# Altium project Gateway_Node.PrjPcb
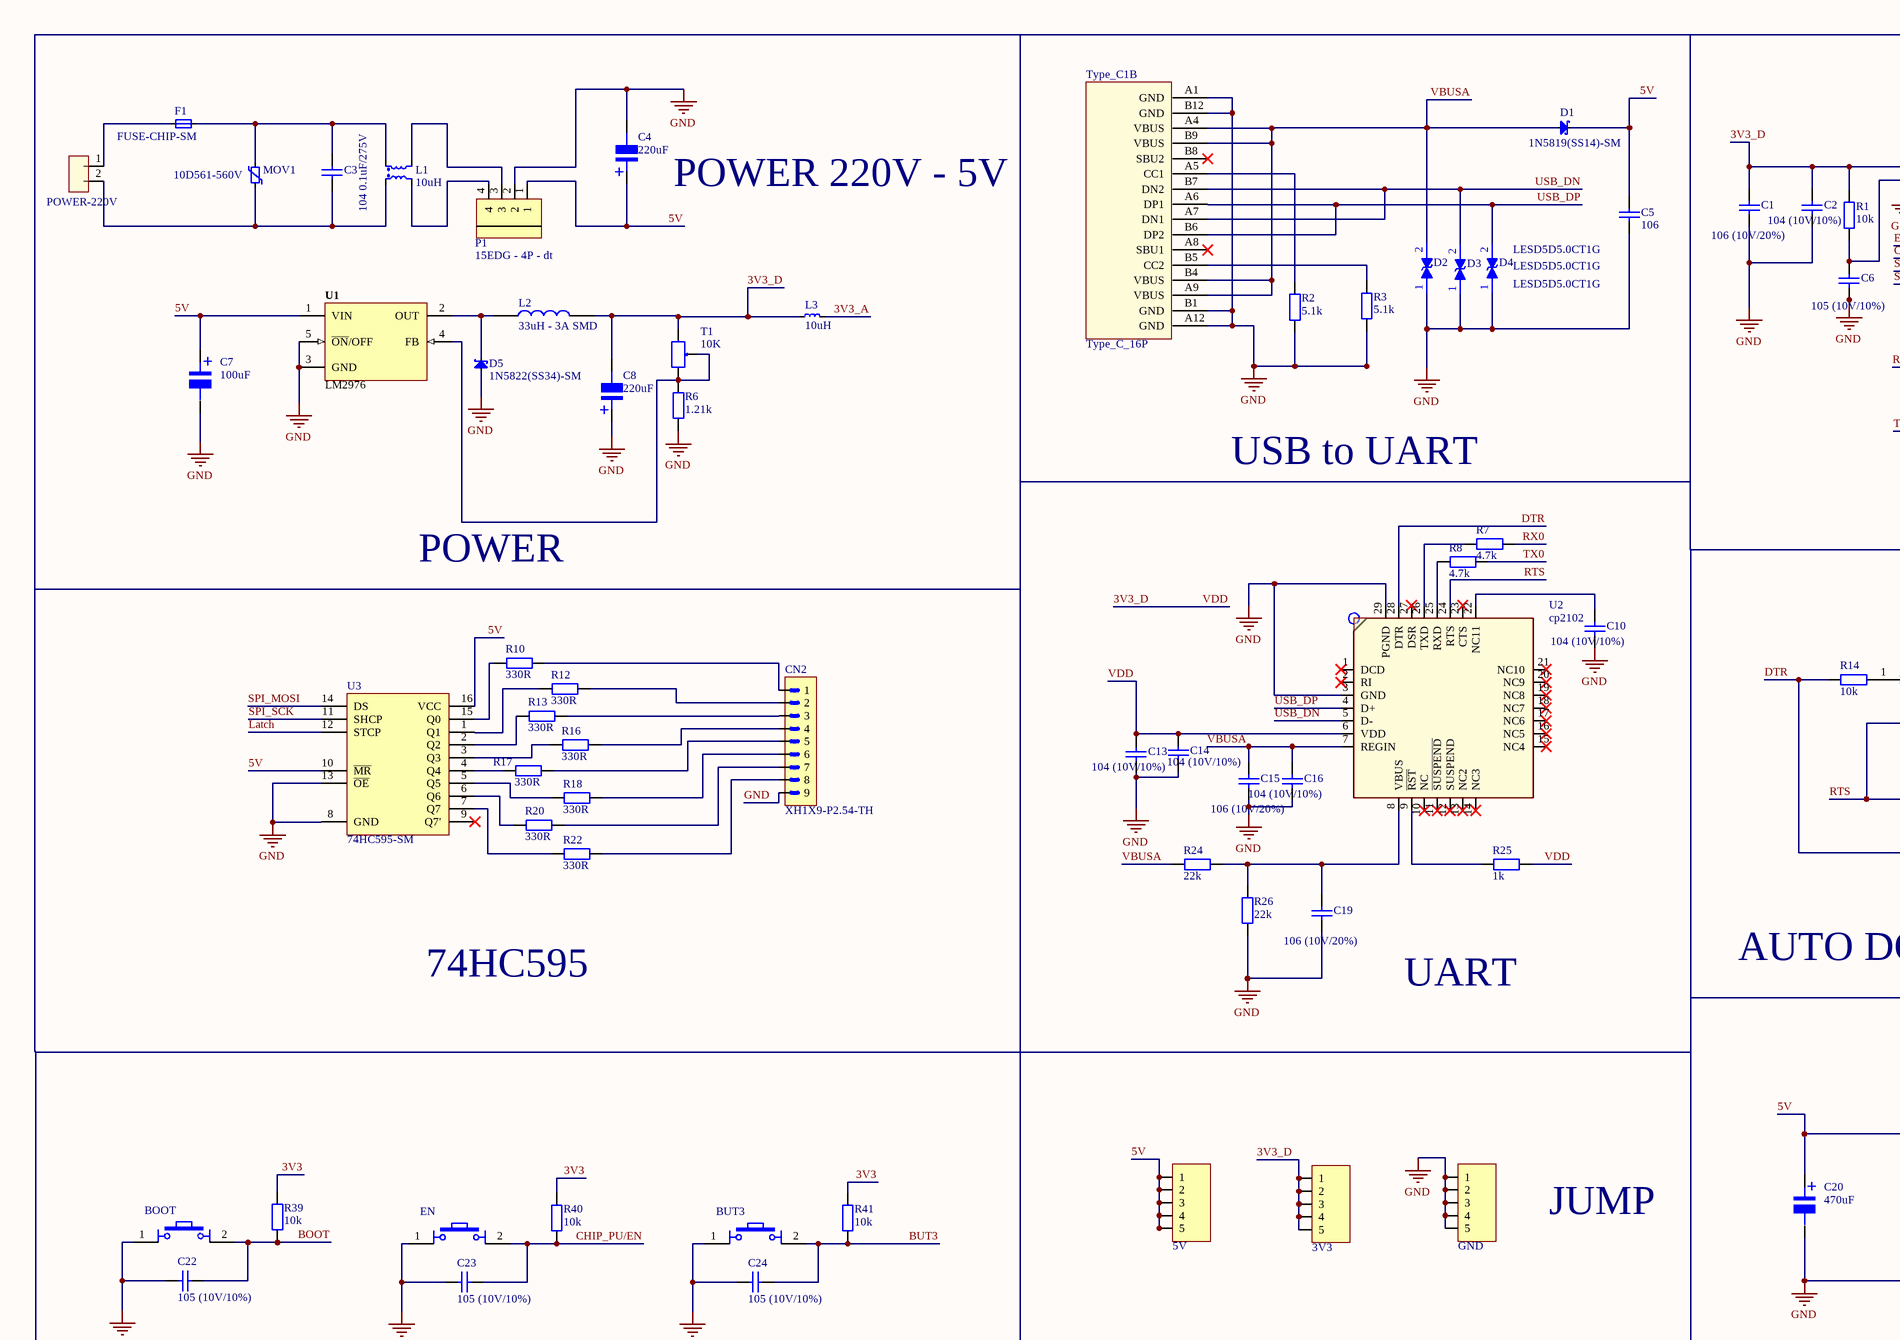
[diagram p0: Sche_gateway.SchDoc, top left]
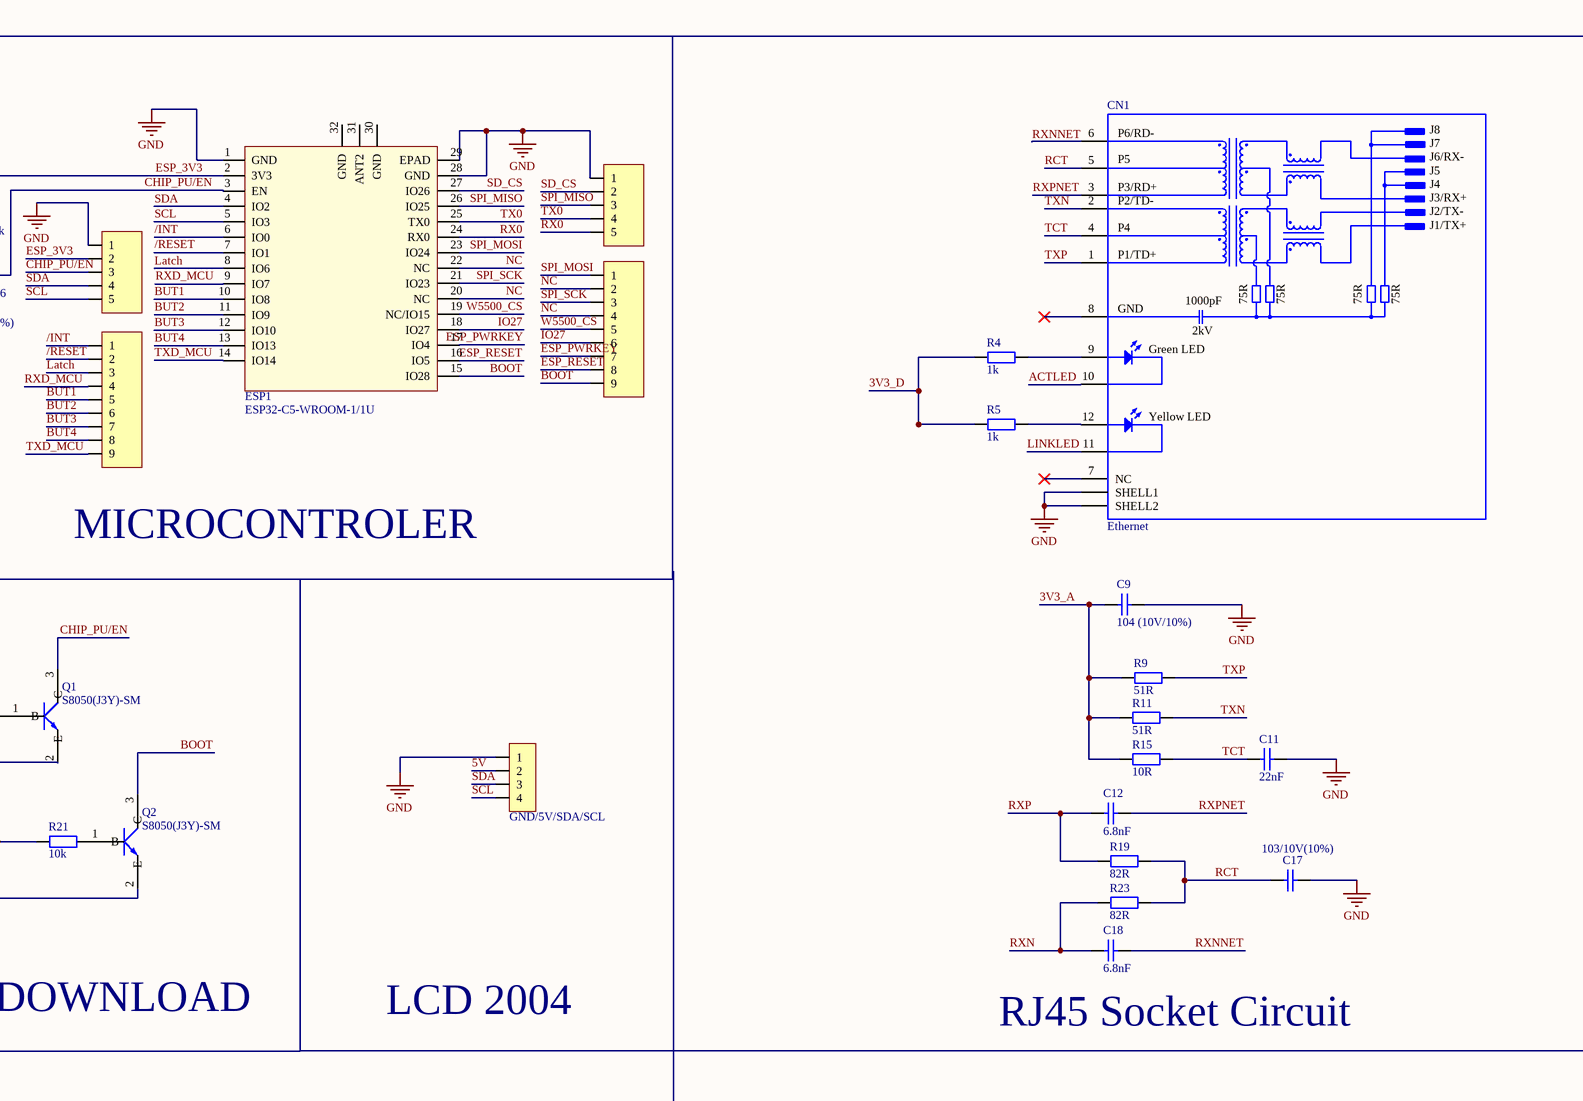
[diagram p1: Sche_gateway.SchDoc, top right]
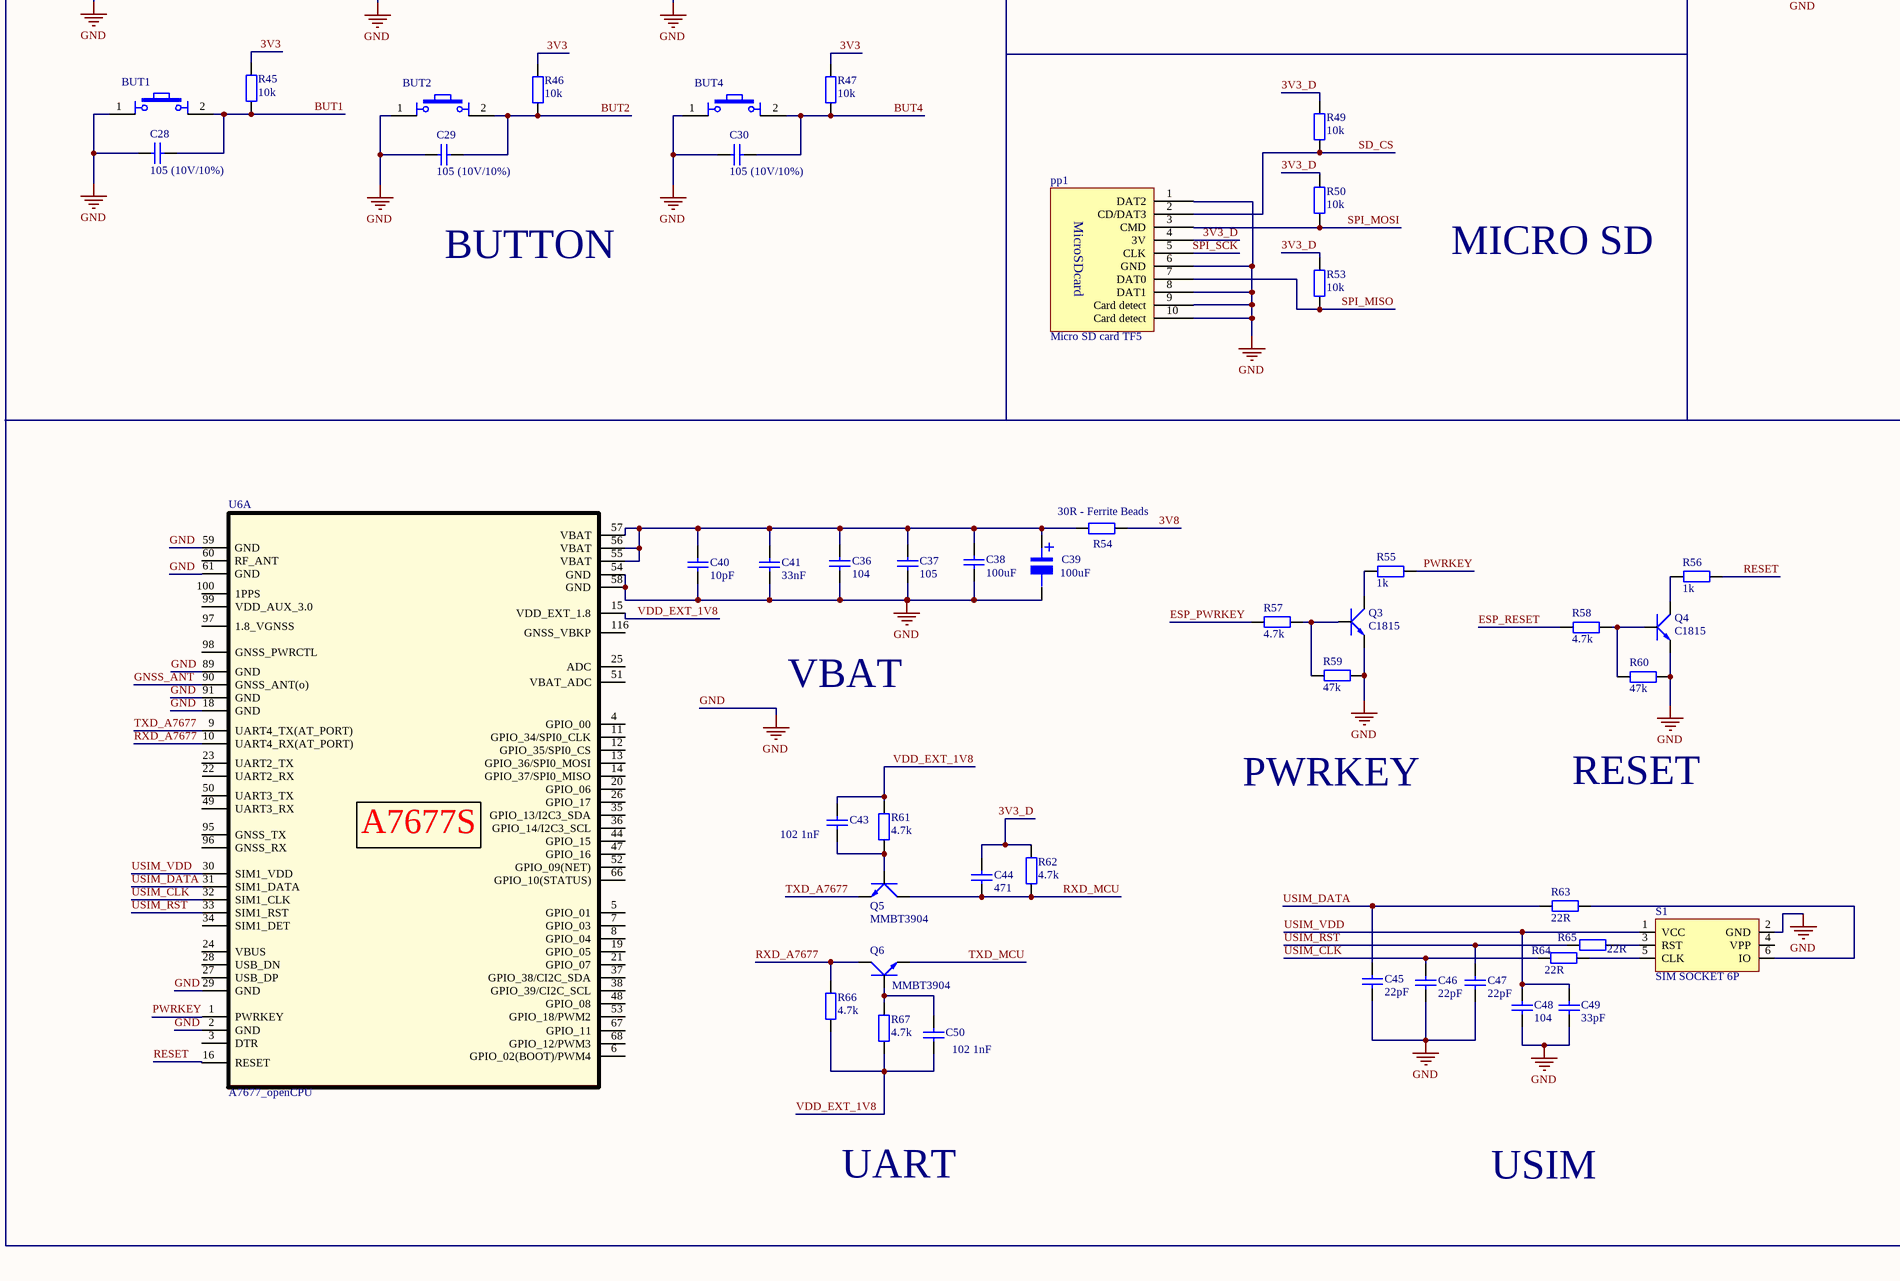
[diagram p2: Sche_gateway.SchDoc, bottom left]
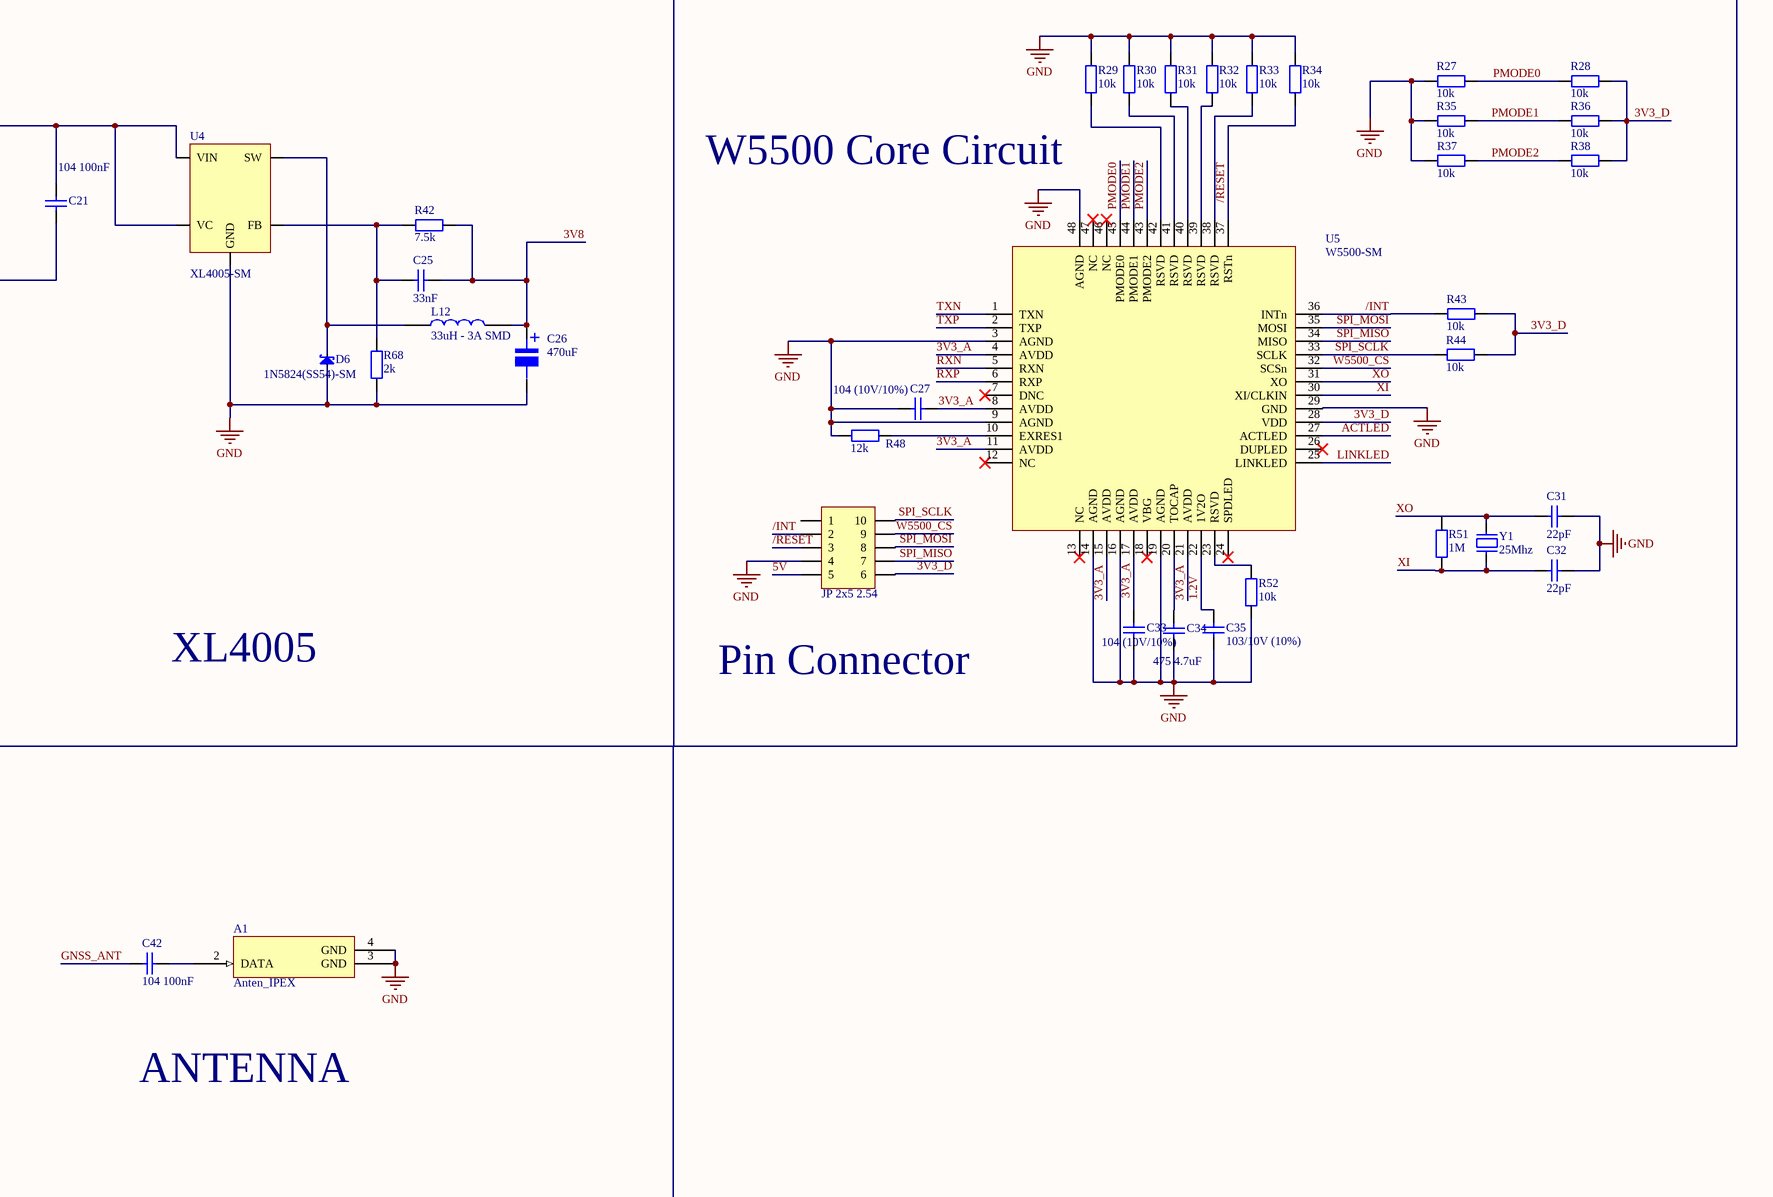
[diagram p3: Sche_gateway.SchDoc, bottom right]
1 sheet, 168 parts. Net scope: global (net labels, ports and power ports of the same name join across sheets).
Board file: PCB_Gateway.PcbDoc

## Sheet Sche_gateway.SchDoc
size 699 x 599 mm; SheetNumber: 1; SheetTotal: 1

### Parts
A1  Anten_IPEX  [Anten_IPEX]
BT1  BOOT  [Nut Nhan 4 Chan Cam 6x6]
BT2  EN  [Nut Nhan 4 Chan Cam 6x6]
BT3  BUT3  [Nut Nhan 4 Chan Cam 6x6]
BT4  BUT1  [Nut Nhan 4 Chan Cam 6x6]
BT5  BUT2  [Nut Nhan 4 Chan Cam 6x6]
BT6  BUT4  [Nut Nhan 4 Chan Cam 6x6]
C1  106 (10V/20%)  [tu 0805]
C2  104 (10V/10%)  [tu 0805]
C3  104 0.1uF/275V  [tu 0805]
C4  220uF  [tu nhom 8 (e)]
C5  106  [tu 0805]
C6  105 (10V/10%)  [tu 0805]
C7  100uF  [tu nhom 8 (f)]
C8  220uF  [tu nhom 8 (e)]
C9  104 (10V/10%)  [tu 0805]
C10  104 (10V/10%)  [tu 0805]
C11  22nF  [tu 1206]
C12  6.8nF  [tu 0805]
C13  104 (10V/10%)  [tu 0805]
C14  104 (10V/10%)  [tu 0805]
C15  106 (10V/20%)  [tu 0805]
C16  104 (10V/10%)  [tu 0805]
C17  103/10V(10%)  [tu 1206]
C18  6.8nF  [tu 0805]
C19  106 (10V/20%)  [tu 0805]
C20  470uF  [tu nhom 10 (G)]
C21  104 100nF  [tu 0805]
C22  105 (10V/10%)  [tu 0805]
C23  105 (10V/10%)  [tu 0805]
C24  105 (10V/10%)  [tu 0805]
C25  33nF  [tu 0805]
C26  470uF  [tu nhom 10 (G)]
C27  104 (10V/10%)  [tu 0805]
C28  105 (10V/10%)  [tu 0805]
C29  105 (10V/10%)  [tu 0805]
C30  105 (10V/10%)  [tu 0805]
C31  22pF  [tu 0805]
C32  22pF  [tu 0805]
C33  104 (10V/10%)  [tu 0805]
C34  475 4.7uF  [tu 0805]
C35  103/10V (10%)  [tu 0805]
C36  104  [tu 0805]
C37  105  [tu 0805]
C38  100uF  [tu 0805]
C39  100uF  [tu nhom 6.3 (d)]
C40  10pF  [tu 0805]
C41  33nF  [tu 0805]
C42  104 100nF  [tu 0805]
C43  102 1nF  [tu 0805]
C44  471  [tu 0805]
C45  22pF  [tu 0805]
C46  22pF  [tu 0805]
C47  22pF  [tu 0805]
C48  104  [tu 0805]
C49  33pF  [tu 0805]
C50  102 1nF  [tu 0805]
CN1  Ethernet  [RJ45-HR911105A-TH]
CN2  XH1X9-P2.54-TH  [XH1X9M-P2.54-TH]
D1  1N5819(SS14)-SM  [SMA-J_DO-214AC]
D2  LESD5D5.0CT1G  [LESD5D5.0CT1G,]
D3  LESD5D5.0CT1G  [LESD5D5.0CT1G,]
D4  LESD5D5.0CT1G  [LESD5D5.0CT1G,]
D5  1N5822(SS34)-SM  [SMA-J_DO-214AC]
D6  1N5824(SS54)-SM  [SMA-J_DO-214AC]
ESP1  ESP32-C5-WROOM-1/1U  [ESP32-C5-WROOM-1/1U]
F1  FUSE-CHIP-SM  [FUSE-CHIP-1812-SM]
HB1  POWER-220V  [HB9500]
JP1  JP esp  [JP 1x5 DT]  (value not drawn)
JP2  JP esp  [JP 1x5 DT]  (value not drawn)
JP3  JP esp  [JP 1x9 DT]  (value not drawn)
JP4  JP esp  [JP 1x9 DT]  (value not drawn)
JP5  GND/5V/SDA/SCL  [JP 1x4 DT]
JP6  5V  [JP 1x5 DT]
JP7  3V3  [JP 1x5 DT]
JP8  GND  [JP 1x5 DT]
JP9  JP 2x5 2.54  [JP 2x5 DT]
L1  10uH  [L-UU9.8-L17.0-W12.0-H17.0-TH]
L2  33uH - 3A SMD  [Cuon Cam 12x12x10]
L3  10uH  [L-CHIP-0805-T1.05-SM]
L12  33uH - 3A SMD  [Cuon Cam 12x12x10]
MOV1  10D561-560V  [MOV-P7.5-D17.0-T3.6-TH]
P1  15EDG - 4P - dt  [15EDG - 4P - dt]
pp1  Micro SD card TF5  [MicroSD TF V5]
Q1  S8050(J3Y)-SM  [SOT23-3_TO-236AB]
Q2  S8050(J3Y)-SM  [SOT23-3_TO-236AB]
Q3  C1815  [SOT23]
Q4  C1815  [SOT23]
Q5  MMBT3904  [SOT23-3_TO-236AB]
Q6  MMBT3904  [SOT23-3_TO-236AB]
R1  10k  [tro smd 0805]
R2  5.1k  [tro smd 0805]
R3  5.1k  [tro smd 0805]
R4  1k  [tro smd 0805]
R5  1k  [tro smd 0805]
R6  1.21k  [tro smd 1206]
R7  4.7k  [tro smd 0805]
R8  4.7k  [tro smd 0805]
R9  51R  [tro smd 0805]
R10  330R  [Tro SMD 0805]
R11  51R  [tro smd 0805]
R12  330R  [Tro SMD 0805]
R13  330R  [Tro SMD 0805]
R14  10k  [tro smd 0805]
R15  10R  [tro smd 0805]
R16  330R  [Tro SMD 0805]
R17  330R  [Tro SMD 0805]
R18  330R  [Tro SMD 0805]
R19  82R  [tro smd 0805]
R20  330R  [Tro SMD 0805]
R21  10k  [tro smd 0805]
R22  330R  [Tro SMD 0805]
R23  82R  [tro smd 0805]
R24  22k  [tro smd 0805]
R25  1k  [tro smd 0805]
R26  22k  [tro smd 0805]
R27  10k  [tro smd 0805]
R28  10k  [tro smd 0805]
R29  10k  [tro smd 0805]
R30  10k  [tro smd 0805]
R31  10k  [tro smd 0805]
R32  10k  [tro smd 0805]
R33  10k  [tro smd 0805]
R34  10k  [tro smd 0805]
R35  10k  [tro smd 0805]
R36  10k  [tro smd 0805]
R37  10k  [tro smd 0805]
R38  10k  [tro smd 0805]
R39  10k  [tro smd 0805]
R40  10k  [tro smd 0805]
R41  10k  [tro smd 0805]
R42  7.5k  [tro smd 0805]
R43  10k  [tro smd 0805]
R44  10k  [tro smd 0805]
R45  10k  [tro smd 0805]
R46  10k  [tro smd 0805]
R47  10k  [tro smd 0805]
R48  12k  [tro smd 0805]
R49  10k  [tro smd 0805]
R50  10k  [tro smd 0805]
R51  1M  [tro smd 0805]
R52  10k  [tro smd 0805]
R53  10k  [tro smd 0805]
R54  30R - Ferrite Beads  [Tro SMD 0805]
R55  1k  [tro smd 0805]
R56  1k  [tro smd 0805]
R57  4.7k  [tro smd 0805]
R58  4.7k  [tro smd 0805]
R59  47k  [tro smd 0805]
R60  47k  [tro smd 0805]
R61  4.7k  [tro smd 0805]
R62  4.7k  [tro smd 0805]
R63  22R  [tro smd 0805]
R64  22R  [tro smd 0805]
R65  22R  [tro smd 0805]
R66  4.7k  [tro smd 0805]
R67  4.7k  [tro smd 0805]
R68  2k  [tro smd 0805]
S1  SIM SOCKET 6P  [SIM SOCKET 6P]
T1  10K  [Bien Tro Vi Chinh Dung]
Type_C1  Type_C_16P  [Type_C_16P]  (part B of 2)
U1  LM2976  [TO263]
U2  cp2102  [cp2102]
U3  74HC595-SM  [TSSOP16-0.65-4.4MM]
U4  XL4005-SM  [D2PAK-6_TO-263BA]
U5  W5500-SM  [LQFP48-0.5-7X7MM]
U6  A7677_openCPU  [A7677]  (part A of 2)
Y1  25Mhz  [Thach Anh 2 chan cam]

### Nets
GND: A1.3(GND) A1.4(GND) BT1.1 BT2.1 BT3.1 BT4.1 BT5.1 BT6.1 C1.2 C2.2 C4.2 C5.2 C6.2 C7.2 C8.1 C9.2 C10.2 C11.1 C13.2 C14.2 C15.2 C16.2 C17.2 C19.2 C20.2 C21.2 C22.1 C23.1 C24.1 C26.2 C27.1 C28.1 C29.1 C30.1 C31.1 C32.1 C33.2 C34.2 C35.2 C36.2 C37.2 C38.2 C39.2 C40.2 C41.2 C45.2 C46.2 C47.2 C48.2 C49.2 CN1.SHELL1 CN1.SHELL2 CN2.9 D2.1 D3.1 D4.1 D5.1 D6.1 ESP1.1(GND) ESP1.28(GND) ESP1.29(EPAD) JP1.1 JP2.1 JP5.1 JP8.1 JP8.2 JP8.3 JP8.4 JP8.5 JP9.4 P1.2 pp1.1(DAT2) pp1.6(GND) pp1.8(DAT1) pp1.9(Card_detect) pp1.10(Card_detect) Q3.2(E) Q4.2(E) R2.1 R3.1 R6.1 R26.1 R27.1 R29.2 R30.2 R31.2 R32.2 R33.2 R34.2 R35.1 R37.1 R48.1 R52.1 R59.2 R60.2 R68.1 S1.2(GND) Type_C1.A1(GND) Type_C1.A12(GND) Type_C1.B1(GND) Type_C1.B12(GND) U1.3(GND) U1.5(~{ON}/OFF) U2.3(GND) U2.29(PGND) U3.8(GND) U3.13(~{OE}) U4.1(GND) U5.3(AGND) U5.9(AGND) U5.14(AGND) U5.16(AGND) U5.19(AGND) U5.29(GND) U5.48(AGND) U6.2(GND) U6.18(GND) U6.29(GND) U6.54(GND) U6.58(GND) U6.59(GND) U6.61(GND) U6.89(GND) U6.91(GND)
1.2V: C35.1 U5.22(1V2O)
3V3: R39.2 R40.2 R41.2 R45.2 R46.2 R47.2
3V3_A: C9.1 C27.2 C33.1 L3.2 R9.1 R11.1 R15.1 U5.4(AVDD) U5.8(AVDD) U5.11(AVDD) U5.15(AVDD) U5.17(AVDD) U5.21(AVDD)
3V3_D: C1.1 C2.1 C8.2 C13.1 C14.1 C44.1 ESP1.2(3V3) JP2.2 JP7.1 JP7.2 JP7.3 JP7.4 JP7.5 JP9.6 L2.2 L3.1 pp1.4(3V) R1.2 R4.1 R5.1 R25.2 R28.2 R36.2 R38.2 R43.2 R44.2 R49.2 R50.2 R53.2 R62.2 T1.1 U2.6(VDD) U5.28(VDD)  [also labelled ESP_3V3, VDD]
3V8: C25.1 C26.1 L12.2 R42.2 R54.2
5V: C4.1 C5.1 C7.1 C20.1 C21.1 D1.2 JP5.2 JP6.1 JP6.2 JP6.3 JP6.4 JP6.5 JP9.5 P1.1 U1.1(VIN) U3.10(~{MR}) U3.16(VCC) U4.4(VC) U4.5(VIN)
/INT: ESP1.6(IO0) JP4.1 JP9.2 R43.1 U5.36(INTn)
/RESET: ESP1.7(IO1) JP4.2 JP9.3 R34.1 U5.37(RSTn)
ACTLED: CN1.10(GK) U5.27(ACTLED)
BOOT: BT1.2 C22.2 ESP1.15(IO28) JP3.9 Q2.3(C) R39.1
BUT1: BT4.2 C28.2 ESP1.10(IO8) JP4.5 R45.1
BUT2: BT5.2 C29.2 ESP1.11(IO9) JP4.6 R46.1
BUT3: BT3.2 C24.2 ESP1.12(IO10) JP4.7 R41.1
BUT4: BT6.2 C30.2 ESP1.13(IO13) JP4.8 R47.1
CHIP_PU/EN: BT2.2 C6.1 C23.2 ESP1.3(EN) JP2.3 Q1.3(C) R1.1 R40.1
DTR: Q2.2(E) R14.1 U2.28(DTR)
ESP_PWRKEY: ESP1.17(IO4) JP3.7 R57.2
ESP_RESET: ESP1.16(IO5) JP3.8 R58.2
GNSS_ANT: C42.2 U6.90(GNSS_ANT(o))
IO27: ESP1.18(IO27) JP3.6
Latch: ESP1.8(IO6) JP4.3 U3.12(STCP)
LINKLED: CN1.11(YK) U5.25(LINKLED)
NC: ESP1.20(NC) ESP1.22(NC) JP3.2 JP3.4
PMODE0: R27.2 R28.1 U5.45(PMODE0)
PMODE1: R35.2 R36.1 U5.44(PMODE1)
PMODE2: R37.2 R38.1 U5.43(PMODE2)
PWRKEY: R55.2 U6.1(PWRKEY)
RCT: C17.1 CN1.5(P5) R19.2 R23.2
RESET: R56.2 U6.16(RESET)
RTS: Q1.2(E) R21.1 U2.24(RTS)
RX0: ESP1.24(RX0) JP1.5 R7.2
RXD_A7677: Q6.3(C) R66.2 U6.10(UART4_RX(AT_PORT))
RXD_MCU: C44.2 ESP1.9(IO7) JP4.4 Q5.3(C) R62.1
RXN: C18.2 R23.1 U5.5(RXN)
RXNNET: C18.1 CN1.6(P6/RD-)
RXP: C12.2 R19.1 U5.6(RXP)
RXPNET: C12.1 CN1.3(P3/RD+)
SCL: ESP1.5(IO3) JP2.5 JP5.4
SD_CS: ESP1.27(IO26) JP1.2 pp1.2(CD/DAT3) R49.1
SDA: ESP1.4(IO2) JP2.4 JP5.3
SPI_MISO: ESP1.26(IO25) JP1.3 JP9.7 pp1.7(DAT0) R53.1 U5.34(MISO)
SPI_MOSI: ESP1.23(IO24) JP3.1 JP9.8 pp1.3(CMD) R50.1 U3.14(DS) U5.35(MOSI)
SPI_SCK: ESP1.21(IO23) JP3.3 pp1.5(CLK) U3.11(SHCP)
SPI_SCLK: JP9.10 R44.1 U5.33(SCLK)
TCT: C11.2 CN1.4(P4) R15.2
TX0: ESP1.25(TX0) JP1.4 R8.2
TXD_A7677: Q5.2(E) U6.9(UART4_TX(AT_PORT))
TXD_MCU: ESP1.14(IO14) JP4.9 Q6.2(E)
TXN: CN1.2(P2/TD-) R11.2 U5.1(TXN)
TXP: CN1.1(P1/TD+) R9.2 U5.2(TXP)
USB_DN: D3.2 Type_C1.A7(DN1) Type_C1.B7(DN2) U2.5(D-)
USB_DP: D4.2 Type_C1.A6(DP1) Type_C1.B6(DP2) U2.4(D+)
USIM_CLK: C46.1 R64.1 U6.32(SIM1_CLK)
USIM_DATA: C45.1 R63.1 U6.31(SIM1_DATA)
USIM_RST: C47.1 R65.1 U6.33(SIM1_RST)
USIM_VDD: C48.1 C49.1 S1.1(VCC) U6.30(SIM1_VDD)
VBUSA: C15.1 C16.1 D1.1 D2.2 R24.1 Type_C1.A4(VBUS) Type_C1.A9(VBUS) Type_C1.B4(VBUS) Type_C1.B9(VBUS) U2.7(REGIN)
VDD_EXT_1V8: C43.1 C50.2 R61.2 R66.1 R67.1 U6.15(VDD_EXT_1.8)
W5500_CS: ESP1.19(NC/IO15) JP3.5 JP9.9 U5.32(SCSn)
XI: C32.2 R51.1 U5.30(XI/CLKIN) Y1.1
XO: C31.2 U5.31(XO) Y1.2
NetA1_2: A1.2(DATA) C42.1
NetC3_1: C3.1 F1.2 L1.3 MOV1.1
NetC3_2: C3.2 HB1.2 L1.1 MOV1.2
NetC10_1: C10.1 U2.22(NC11)
NetC19_1: C19.1 R24.2 R26.2 U2.8(VBUS)
NetC25_2: C25.2 R42.1 R68.2 U4.2(FB)
NetC34_1: C34.1 U5.20(TOCAP)
NetC36_1: C36.1 C37.1 C38.1 C39.1 C40.1 C41.1 R54.1 U6.55(VBAT) U6.56(VBAT) U6.57(VBAT)
NetC43_2: C43.2 Q5.1(B) R61.1
NetC50_1: C50.1 Q6.1(B) R67.2
NetCN1_9: CN1.9(GA) R4.2
NetCN1_12: CN1.12(YA) R5.2
NetCN2_1: CN2.1 R10.2
NetCN2_2: CN2.2 R12.2
NetCN2_3: CN2.3 R13.2
NetCN2_4: CN2.4 R16.2
NetCN2_5: CN2.5 R17.2
NetCN2_6: CN2.6 R18.2
NetCN2_7: CN2.7 R20.2
NetCN2_8: CN2.8 R22.2
NetD5_2: D5.2 L2.1 U1.2(OUT)
NetD6_2: D6.2 L12.1 U4.3(SW)
NetF1_1: F1.1 HB1.1
NetL1_2: L1.2 P1.4
NetL1_4: L1.4 P1.3
NetQ1_1: Q1.1(B) R14.2
NetQ2_1: Q2.1(B) R21.2
NetQ3_1: Q3.1(B) R57.1 R59.1
NetQ3_3: Q3.3(C) R55.1
NetQ4_1: Q4.1(B) R58.1 R60.1
NetQ4_3: Q4.3(C) R56.1
NetR2_2: R2.2 Type_C1.A5(CC1)
NetR3_2: R3.2 Type_C1.B5(CC2)
NetR6_2: R6.2 T1.2 T1.3 U1.4(FB)
NetR7_1: R7.1 U2.26(TXD)
NetR8_1: R8.1 U2.25(RXD)
NetR10_1: R10.1 U3.15(Q0)
NetR12_1: R12.1 U3.1(Q1)
NetR13_1: R13.1 U3.2(Q2)
NetR16_1: R16.1 U3.3(Q3)
NetR17_1: R17.1 U3.4(Q4)
NetR18_1: R18.1 U3.5(Q5)
NetR20_1: R20.1 U3.6(Q6)
NetR22_1: R22.1 U3.7(Q7)
NetR25_1: R25.1 U2.9(~{RST})
NetR29_1: R29.1 U5.42(RSVD)
NetR30_1: R30.1 U5.41(RSVD)
NetR31_1: R31.1 U5.40(RSVD)
NetR32_1: R32.1 U5.39(RSVD)
NetR33_1: R33.1 U5.38(RSVD)
NetR48_2: R48.2 U5.10(EXRES1)
NetR52_2: R52.2 U5.23(RSVD)
NetR63_2: R63.2 S1.6(IO)
NetR64_2: R64.2 S1.5(CLK)
NetR65_2: R65.2 S1.3(RST)

Not connected (* = marked no-connect by the designer): CN1 7(NC)* 8(GND)*; ESP1 30(GND) 31(ANT2) 32(GND); JP9 1; R51 2; S1 4(VPP); Type_C1 A8(SBU1)* B8(SBU2)*; U2 1(DCD)* 2(RI)* 10(NC)* 11(~{SUSPEND})* 12(SUSPEND)* 13(NC2)* 14(NC3)* 15(NC4)* 16(NC5)* 17(NC6)* 18(NC7)* 19(NC8)* 20(NC9)* 21(NC10)* 23(CTS)* 27(DSR)*; U3 9(Q7')*; U5 7(DNC)* 12(NC)* 13(NC)* 18(VBG)* 24(SPDLED)* 26(DUPLED)* 46(NC)* 47(NC)*; U6 3(DTR) 4(GPIO_00) 5(GPIO_01) 6(GPIO_02(BOOT)/PWM4) 7(GPIO_03) 8(GPIO_04) 11(GPIO_34/SPI0_CLK) 12(GPIO_35/SPI0_CS) 13(GPIO_36/SPI0_MOSI) 14(GPIO_37/SPI0_MISO) 19(GPIO_05) 20(GPIO_06) 21(GPIO_07) 22(UART2_RX) 23(UART2_TX) 24(VBUS) 25(ADC) 26(GPIO_17) 27(USB_DP) 28(USB_DN) 34(SIM1_DET) 35(GPIO_13/I2C3_SDA) 36(GPIO_14/I2C3_SCL) 37(GPIO_38/CI2C_SDA) 38(GPIO_39/CI2C_SCL) 44(GPIO_15) 47(GPIO_16) 48(GPIO_08) 49(UART3_RX) 50(UART3_TX) 51(VBAT_ADC) 52(GPIO_09(NET)) 53(GPIO_18/PWM2) 60(RF_ANT) 66(GPIO_10(STATUS)) 67(GPIO_11) 68(GPIO_12/PWM3) 93(NC) 95(GNSS_TX) 96(GNSS_RX) 97(NC) 98(NC) 99(VDD_AUX_3.0) 100(1PPS) 101(NC) 102(NC) 103(NC) 104(NC) 105(NC) 106(NC) 107(NC) 116(GNSS_VBKP) 117(NC) 118(NC) 119(NC) 120(NC) 121(NC) 122(NC) 123(NC) 124(NC) 126(NC) 127(NC)

### Notes on the sheet
- (near C4) POWER 220V - 5V
- USB to UART
- (near JP4) MICROCONTROLER
- POWER
- 74HC595
- UART
- AUTO DOWNLOAD
- LCD 2004
- (near C18) RJ45 Socket Circuit
- W5500 Core Circuit
- JUMP
- BUTTON
- MICRO SD
- XL4005
- Pin Connector
- VBAT
- PWRKEY
- RESET
- ANTENNA
- USIM
- (in symbol A7677_openCPU, part A) A7677S
- (in symbol Micro SD card TF5) MicroSDcard
- (in symbol RJ45-HR911105A-TH) J8; J7; J6/RX-; J5; J4; J3/RX+; J2/TX-; J1/TX+; 75R; 1000pF; 2kV; Green LED; Yellow LED
- (in symbol Tu Nhom 100uF 25V) +
- (in symbol Tu Nhom 100uF 50V) +
- (in symbol Tu Nhom 220uF 10V) +
- (in symbol Tu Nhom 470uF 35V) +

### Library data of the parts
BT1-BT6 = Nut Nhan 4 Chan Cam 6x6: Nut Nhan 4 Chan 6x6mm; Ten: Nút Nhấn 4 Chân 6x6x5MM DIP; Ma_Hang: MH004584
C1 C5 C15 C19 = Tu 0805 106 16V 10%: Dán; Ten_Linh_Kien: Tụ 0805 106-10uF 10% 16V; So_Chan: 2; Don_Vi: Con; Ma_Hang: MH004553; Chung_Loai: Dán; Kieu_Chan: *
C2 C3 C9 C10 C13 C14 C16 C21 C27 C33 C35 C36 C42 C48 = Tu 0805 104 50V 10%: Dán; Don_Vi: Con; So_Chan: 2; Ten_Linh_Kien: Tụ 0805 104-100nF 10% 50V; Ma_Hang: MH004551; Chung_Loai: Dán; Kieu_Chan: *
C4 C8 = Tu Nhom 220uF 10V: Dán; So_Chan: 2; Ten_Linh_Kien: Tụ Nhôm 220uF 10V; Ma_Hang: MH004021; Don_Vi: Con; Chung_Loai: Dán; Kieu_Chan: *
C6 C22-C24 C28-C30 C37 = Tu 0805 105 50V 10%: Dán; Don_Vi: Con; So_Chan: 2; Ten_Linh_Kien: Tụ 0805 105-1uF 10% 50V; Ma_Hang: MH004552; Chung_Loai: Dán; Kieu_Chan: *
C7 = Tu Nhom 100uF 50V: Dán; Don_Vi: Con; So_Chan: 2; Ten_Linh_Kien: Tụ Nhôm 100uF 50V 8x10.2MM; Ma_Hang: MH002223; Chung_Loai: Dán; Kieu_Chan: *
C11 = Tu 1206 22pF 50V 10%: Dán; Ma_Hang: MH004547; Don_Vi: Con; So_Chan: 2; Ten_Linh_Kien: Tụ 1206 22P 10% 50V; Chung_Loai: Dán; Kieu_Chan: *
C12 C18 = Tu 0805 680pF 50V 10%: Dán; Don_Vi: Con; So_Chan: 2; Ten_Linh_Kien: Tụ 0805 680pF 50V 10%; Ma_Hang: MH008098; Chung_Loai: Dán; Kieu_Chan: *
C17 = Tu 1206 104 50V 20%: Dán; Don_Vi: Con; So_Chan: 2; Ten_Linh_Kien: Tụ 1206 104-0.1uF 20% 50V; Ma_Hang: MH004544; Chung_Loai: Dán; Kieu_Chan: *
C20 C26 = Tu Nhom 470uF 35V: Dán; Don_Vi: Con; So_Chan: 2; Ten_Linh_Kien: Tụ Nhôm 470uF 35V 10x10.5MM; Ma_Hang: MH004418; Chung_Loai: Dán; Kieu_Chan: *
C25 C38 C41 = Tu 0805 33nF 50V 20%: Dán; Don_Vi: Con; So_Chan: 2; Ten_Linh_Kien: Tụ 0805 33nF 50V 20%; Ma_Hang: MH007854; Kieu_Chan: *; Chung_Loai: Dán
C31 C32 C45-C47 = Tu 0805 22pF 50V 10%: Dán; Don_Vi: Con; So_Chan: 2; Ten_Linh_Kien: Tụ 0805 22P 10% 50V; Ma_Hang: MH004560; Chung_Loai: Dán; Kieu_Chan: *
C34 = Tu 0805 475 25V 20%: Dán; Don_Vi: Con; So_Chan: 2; Ten_Linh_Kien: Tụ 0805 475-4.7uF 20% 25V; Ma_Hang: MH004276; Chung_Loai: Dán; Kieu_Chan: *
C39 = Tu Nhom 100uF 25V: Dán; Don_Vi: Con; So_Chan: 2; Ten_Linh_Kien: Tụ Nhôm 100uF 25V 6x7MM; Ma_Hang: MH002222; Chung_Loai: Dán; Kieu_Chan: *
C40 = Tu 0805 10pF 50V 10%: Dán; Don_Vi: Con; So_Chan: 2; Ten_Linh_Kien: Tụ 0805 10P 10% 50V; Ma_Hang: MH004554; Chung_Loai: Dán; Kieu_Chan: *
C43 C50 = Tu 0805 102 50V 10%: Dán; Don_Vi: Con; So_Chan: 2; Ten_Linh_Kien: Tụ 0805 102-1nF 10% 50V; Ma_Hang: MH004549; Chung_Loai: Dán; Kieu_Chan: *
C44 = Tu 0805 471 50V 10%: Dán; Don_Vi: Con; So_Chan: 2; Ten_Linh_Kien: Tụ 0805 471-470 10% 50V; Ma_Hang: MH004564; Chung_Loai: Dán; Kieu_Chan: *
C49 = Tu 0805 33pF 50V 10%: Dán; Don_Vi: Con; So_Chan: 2; Ten_Linh_Kien: Tụ 0805 33p 10% 50V; Ma_Hang: MH004563; Chung_Loai: Dán; Kieu_Chan: *
CN1 = RJ45-HR911105A-TH: Single Port RJ45 Connector With Magnetics Module And LED - Through Hole
CN2 = XH1X9-P2.54-TH: Connector XH2.54 9P - Through Hole
D1 = 1N5819(SS14)-SM: 1.0A Schottky Barrier Rectifiers - Surface Mount
D5 = 1N5822(SS34)-SM: 3.0A Schottky Barrier Rectifiers - Surface Mount
D6 = 1N5824(SS54)-SM: 5.0A Schottky Barrier Rectifiers - Surface Mount
F1 = FUSE-CHIP-SM: Chip Fuses - Surface Mount
HB1 = HB9500
JP1 JP2 JP6-JP8 = JP 1x5 2.54 Duc Thang: Cắm; Ten_Linh_Kien: Jump Đơn Đực 2.54MM 1x40P Thẳng 11MM; Don_Vi: Con; Ma_Hang: MH000903; Ghi_Chu: *; Kieu_Chan: *; Chung_Loai: Cắm
JP3 JP4 = JP 1x9 2.54 Duc Thang: Cắm; Ten_Linh_Kien: Jump Đơn Đực 2.54MM 1x40P Thẳng 11MM; Don_Vi: Con; Ma_Hang: MH000903; Ghi_Chu: *; Kieu_Chan: *; Chung_Loai: Cắm
JP5 = JP 1x4 2.54 Duc Thang: Cắm; Ten_Linh_Kien: Jump Đơn Đực 2.54MM 1x40P Thẳng 11MM; Don_Vi: Con; Ma_Hang: MH000903; Ghi_Chu: *; Kieu_Chan: *; Chung_Loai: Cắm
JP9 = JP 2x5 2.54 Duc Thang: Cắm; Ten_Linh_Kien: Jump Đôi Đực 2.54MM 2x40P Thẳng 11MM; Don_Vi: Con; Ma_Hang: MH002686; Ghi_Chu: *; Kieu_Chan: *; Chung_Loai: Cắm
L1 = L-FILTER-TH: EMI Filter Inductor - Through Hole
L2 L12 = CUON CAM 100uH SMD: Dán; Don_Vi: Con; Ma_Hang: MH003999; Ten_Linh_Kien: Cuộn Cảm 100uH 7x7x4MM CD74; Ma_Hang: *; Kieu_Chan: *; Chung_Loai: Dán
L3 = L-CHIP-SM: Chip Inductor - Surface Mount
MOV1 = MOV-TH: Metal Oxide Varistor - Through Hole
P1 = 15EDG - 4P - dt: 15EDG - 4P - 3.81 mm - đực thẳng
Q1 Q2 = S8050(J3Y)-SM: 0.5A 25V NPN General Purpose Transistors - Surface Mount
Q3 Q4 = C1815 HF SMD: NPN transistor; Value: C9014
Q5 Q6 = 2N3904(1AM)-SM: NPN General Purpose Transistors 0.2A 40V - Surface Mount
R1 R14 R21 R27-R41 R43-R47 R49 R50 R52 R53 = Tro 0805 5% 10k: Dán; Don_Vi: Con; So_Chan: 2; Ten_Linh_Kien: Trở 0805 5% 10k; Ma_Hang: MH005239; Chung_Loai: Dán; Kieu_Chan: *
R2 R3 = Tro 0805 1% 5.1k: Dán; Don_Vi: Con; So_Chan: 2; Ten_Linh_Kien: Trở 0805 1% 5.1k; Ma_Hang: MH008812; Chung_Loai: Dán; Kieu_Chan: *
R4 R5 R55 R56 = Tro 0805 5% 1k: Dán; Don_Vi: Con; So_Chan: 2; Ten_Linh_Kien: Trở 0805 5% 1k; Ma_Hang: MH005234; Chung_Loai: Dán; Kieu_Chan: *
R6 = Tro 1206 5% 1k: Dán; Don_Vi: Con; So_Chan: 2; Ten_Linh_Kien: Trở 1206 5% 1k; Ma_Hang: MH005904; Chung_Loai: Dán; Kieu_Chan: *
R7 R8 R42 R57 R58 R61 R62 R66 R67 = Tro 0805 5% 4.7k: Dán; Don_Vi: Con; So_Chan: 2; Ten_Linh_Kien: Trở 0805 5% 4.7k; Ma_Hang: MH005307; Chung_Loai: Dán; Kieu_Chan: *
R9 R11 = Tro 0805 5% 30R: Dán; Don_Vi: Con; So_Chan: 2; Ten_Linh_Kien: Trở 0805 5% 30R; Ma_Hang: MH005315; Chung_Loai: Dán; Kieu_Chan: *
R10 R12 R13 R16-R18 R20 R22 = Tro 0805 5% 330R: Dán; Don_Vi: Con; So_Chan: 2; Ten_Linh_Kien: Trở 0805 5% 330R; Ma_Hang: MH005337; Chung_Loai: Dán; Kieu_Chan: *
R15 = Tro 0805 5% 10R: Dán; Don_Vi: Con; So_Chan: 2; Ten_Linh_Kien: Trở 0805 5% 10R; Ma_Hang: MH005240; Chung_Loai: Dán; Kieu_Chan: *
R19 R23 = Tro 0805 5% 62R: Dán; Don_Vi: Con; So_Chan: 2; Ten_Linh_Kien: Trở 0805 5% 62R; Ma_Hang: MH005324; Chung_Loai: Dán; Kieu_Chan: *
R24 R26 = Tro 0805 5% 22k: Dán; Don_Vi: Con; So_Chan: 2; Ten_Linh_Kien: Trở 0805 5% 22k; Ma_Hang: MH005248; Chung_Loai: Dán; Kieu_Chan: *
R25 = Tro 0805 1% 1k: Dán; Don_Vi: Con; So_Chan: 2; Ten_Linh_Kien: Trở 0805 1% 1k; Ma_Hang: MH005468; Chung_Loai: Dán; Kieu_Chan: *
R48 = Tro 0805 5% 12k: Dán; Don_Vi: Con; So_Chan: 2; Ten_Linh_Kien: Trở 0805 5% 12k; Ma_Hang: MH005241; Chung_Loai: Dán; Kieu_Chan: *
R51 = Tro 0805 1% 1M: Dán; Don_Vi: Con; So_Chan: 2; Ten_Linh_Kien: Trở 0805 1% 1M; Ma_Hang: MH005469; Chung_Loai: Dán; Kieu_Chan: *
R54 = Tro 0805 5% 390R: Dán; Don_Vi: Con; So_Chan: 2; Ten_Linh_Kien: Trở 0805 5% 390R; Ma_Hang: MH005339; Chung_Loai: Dán; Kieu_Chan: *
R59 R60 = Tro 0805 5% 47k: Dán; Don_Vi: Con; So_Chan: 2; Ten_Linh_Kien: Trở 0805 5% 47k; Ma_Hang: MH005320; Chung_Loai: Dán; Kieu_Chan: *
R63-R65 = Tro 0805 5% 22R: Dán; Don_Vi: Con; So_Chan: 2; Ten_Linh_Kien: Trở 0805 5% 22R; Ma_Hang: MH005249; Chung_Loai: Dán; Kieu_Chan: *
R68 = Tro 0805 1% 2k: Dán; Don_Vi: Con; So_Chan: 2; Ten_Linh_Kien: Trở 0805 1% 2k; Ma_Hang: MH005471; Chung_Loai: Dán; Kieu_Chan: *
T1 = Bien Tro Tinh Chinh 10K Dung: Cắm; Ma_Hang: MH003232; Ten_Linh_Kien: Biến Trở VR 103-10K 3296W; Don_Vi: Con; Kieu_Chan: *; Chung_Loai: Cắm; Ghi_Chu: *
U1 = LM2596: Max Input Voltage: 12 V; Max Output Current: 3 (6.0 peak) A; Max Output Voltage: mV; Category: IC-Power; Min Input Voltage: mV; Min Output Voltage: mV; Mounting Technology: Surface Mount; Status: Unreleased; Supply Voltage: mV; Temperature Range: -40 to +125 degC
U3 = 74HC595-SM: 8-Bit Shift Registers With 3-State Output Registers - Surface Mount
U4 = XL4015-SM: 5A 180KHz 36V Buck DC to DC Converter - Surface Mount
U5 = W5500-SM: Ethernet ICs 3in1 Enet Controller TCP/IP +MAC+PHY - Surface Mount
U6 = A7677_openCPU: LTE CAT 1 module, 4G + (GNSS); Mfr: *; Mpn: *; Value: *
Y1 = Thach Anh 2 chan Cam: Crystal For all Crystal 2pin.; Value: 4Mhz